# Altium schematic sheet daughter_board.SchDoc: LilyGo T-Display-S3 AMOLED Plus power daughter board
size A4; Revision: 0.2; SheetNumber: 1; SheetTotal: 1
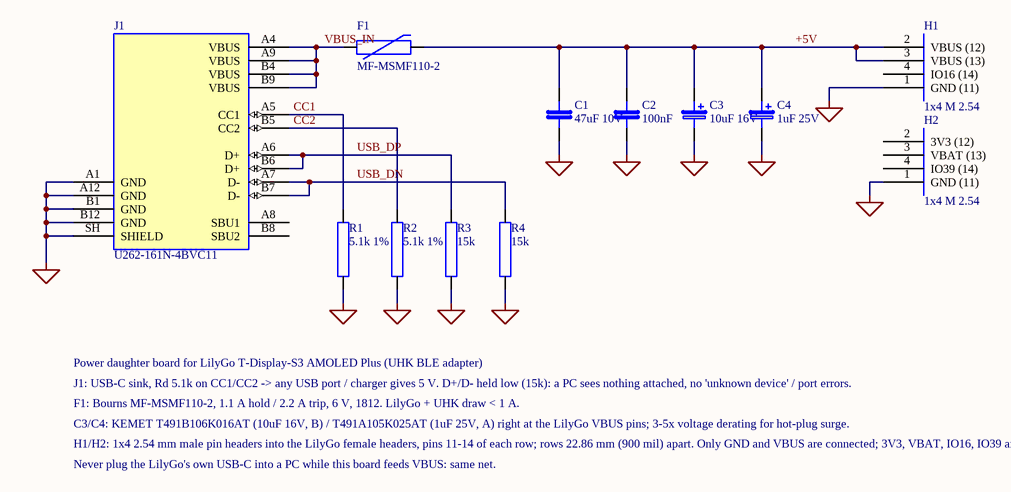
[diagram p0: daughter_board.SchDoc]

## Parts
C1  47uF 10V  [C_1206_3216Metric]
C2  100nF  [C_0603_1608Metric]
C3  10uF 16V  [CP_EIA-3528-21_Kemet-B]
C4  1uF 25V  [CP_EIA-3216-18_Kemet-A]
F1  MF-MSMF110-2  [Fuse_1812_4532Metric]
H1  1x4 M 2.54  [PinHeader_1x04_P2.54mm_Vertical]
H2  1x4 M 2.54  [PinHeader_1x04_P2.54mm_Vertical]
J1  U262-161N-4BVC11  [USB_C_Receptacle_XKB_U262-16XN-4BVC11]
R1  5.1k 1%  [R_0603_1608Metric]
R2  5.1k 1%  [R_0603_1608Metric]
R3  15k  [R_0603_1608Metric]
R4  15k  [R_0603_1608Metric]

## Nets
GND: C1.2 C2.2 C3.2(-) C4.2(-) H1.1(GND_(11)) H2.1(GND_(11)) J1.A1(GND) J1.A12(GND) J1.B1(GND) J1.B12(GND) J1.SH(SHIELD) R1.2 R2.2 R3.2 R4.2
+5V: C1.1 C2.1 C3.1(+) C4.1(+) F1.2 H1.2(VBUS_(12)) H1.3(VBUS_(13))
CC1: J1.A5(CC1) R1.1
CC2: J1.B5(CC2) R2.1
USB_DN: J1.A7(D-) J1.B7(D-) R4.1
USB_DP: J1.A6(D+) J1.B6(D+) R3.1
VBUS_IN: F1.1 J1.A4(VBUS) J1.A9(VBUS) J1.B4(VBUS) J1.B9(VBUS)

Not connected (* = marked no-connect by the designer): H1 4(IO16_(14)); H2 2(3V3_(12)) 3(VBAT_(13)) 4(IO39_(14)); J1 A8(SBU1) B8(SBU2)

## Notes on the sheet
- Power daughter board for LilyGo T-Display-S3 AMOLED Plus (UHK BLE adapter)
- J1: USB-C sink, Rd 5.1k on CC1/CC2 -> any USB port / charger gives 5 V. D+/D- held low (15k): a PC sees nothing attached, no 'unknown device' / port errors.
- F1: Bourns MF-MSMF110-2, 1.1 A hold / 2.2 A trip, 6 V, 1812. LilyGo + UHK draw < 1 A.
- C3/C4: KEMET T491B106K016AT (10uF 16V, B) / T491A105K025AT (1uF 25V, A) right at the LilyGo VBUS pins; 3-5x voltage derating for hot-plug surge.
- H1/H2: 1x4 2.54 mm male pin headers into the LilyGo female headers, pins 11-14 of each row; rows 22.86 mm (900 mil) apart. Only GND and VBUS are connected; 3V3, VBAT, IO16, IO39 are for mechanical grip only.
- Never plug the LilyGo's own USB-C into a PC while this board feeds VBUS: same net.

## Library data of the parts
C1 = CAP: Bulk, X5R 1206
C2 = CAP: Decoupling, 0603, X5R
C3 = CAP_POL: Tantalum MnO2, case B 3528, at the LilyGo VBUS pins; Manufacturer: KEMET; MPN: T491B106K016AT
C4 = CAP_POL: Tantalum MnO2, case A 3216, at the LilyGo VBUS pins; Manufacturer: KEMET; MPN: T491A105K025AT
F1 = PTC_FUSE: PTC resettable fuse, 1.1 A hold / 2.2 A trip, 6 V, 1812; Manufacturer: Bourns; MPN: MF-MSMF110-2
H1 = LILYGO_L11-14: Male pin header into the LilyGo left female header, pins 11-14
H2 = LILYGO_R11-14: Male pin header into the LilyGo right female header, pins 11-14, 22.86 mm from H1
J1 = USB_C_16P: USB-C 2.0 receptacle, 16P, top mount, power input (sink); JLC/LCSC C319148; Manufacturer: XKB Connection; MPN: U262-161N-4BVC11
R1 = RES: CC1 sink pull-down (Rd), 0603
R2 = RES: CC2 sink pull-down (Rd), 0603
R3 = RES: D+ held low, 0603
R4 = RES: D- held low, 0603